# Altium schematic sheet 01_TOP.SchDoc: Diagrama de bloques (hoja TOP)
size 420 x 297 mm; Address1: Hardware en IoT · 2026; SheetNumber: 1; SheetTotal: 6
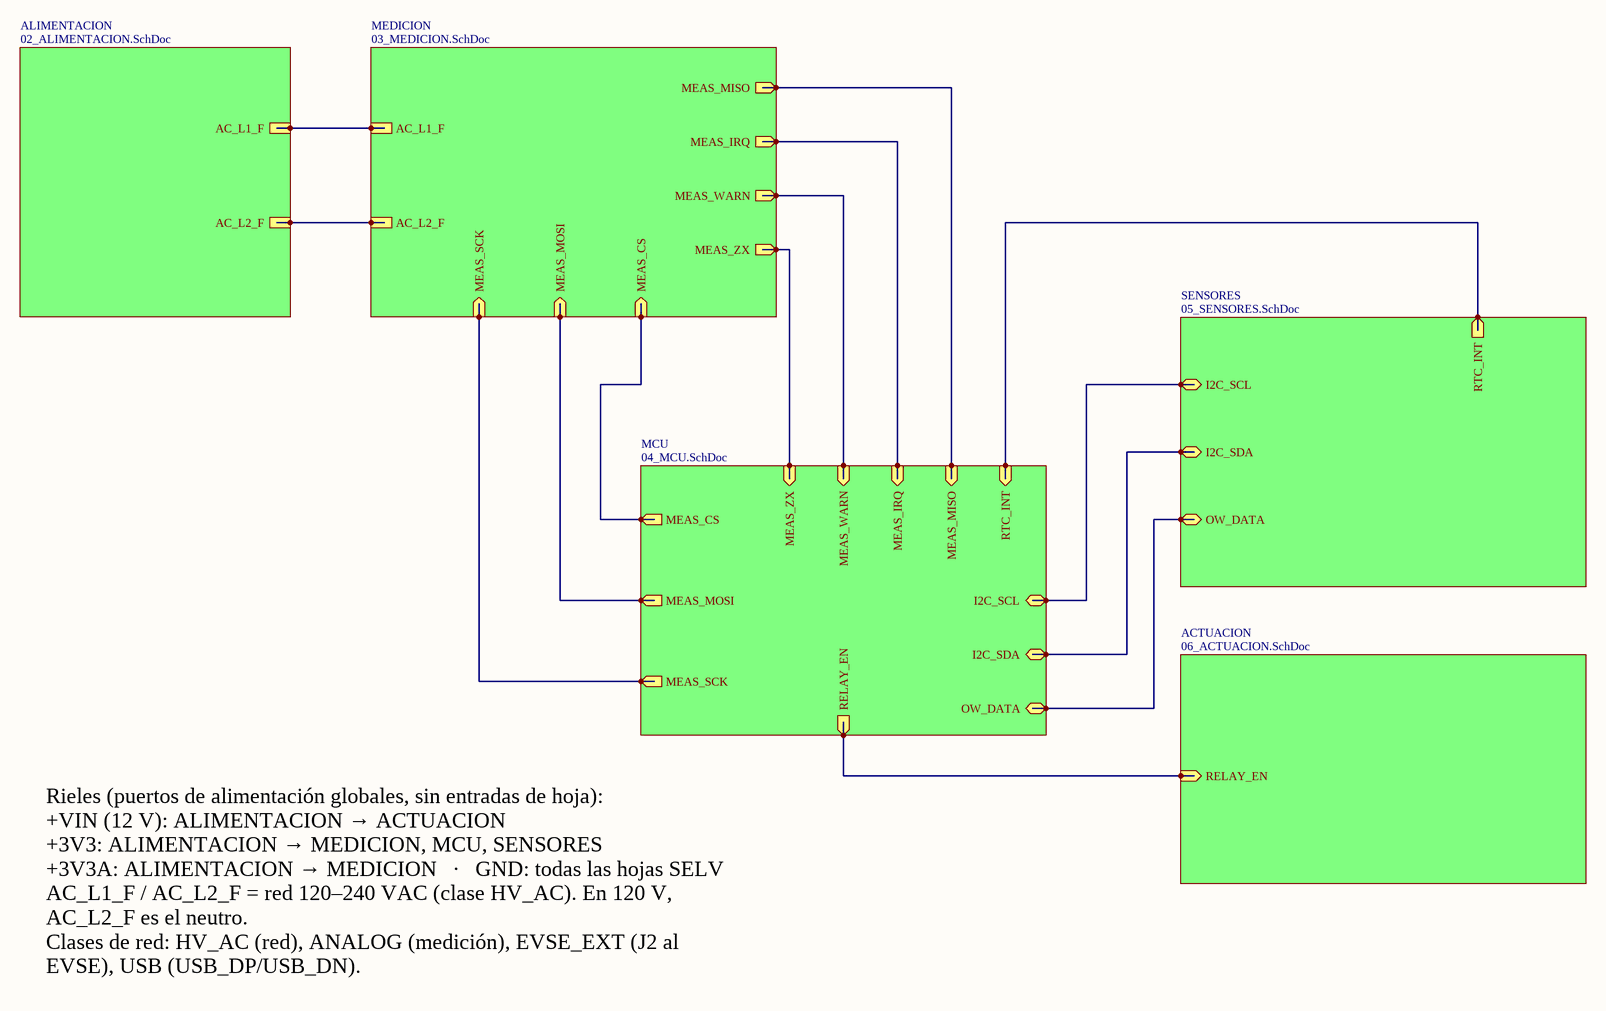
[diagram p0: 01_TOP.SchDoc]

## Sub-sheets
ACTUACION = 06_ACTUACION.SchDoc: RELAY_EN (in)
ALIMENTACION = 02_ALIMENTACION.SchDoc: AC_L1_F, AC_L2_F
MCU = 04_MCU.SchDoc: MEAS_MISO (in), MEAS_IRQ (in), I2C_SDA (bidir), I2C_SCL (bidir), MEAS_SCK (out), MEAS_MOSI (out), MEAS_CS (out), RELAY_EN (out), MEAS_WARN (in), MEAS_ZX (in), RTC_INT (in), OW_DATA (bidir)
MEDICION = 03_MEDICION.SchDoc: AC_L1_F, AC_L2_F, MEAS_IRQ (out), MEAS_WARN (out), MEAS_MISO (out), MEAS_ZX (out), MEAS_SCK (in), MEAS_MOSI (in), MEAS_CS (in)
SENSORES = 05_SENSORES.SchDoc: I2C_SCL (bidir), I2C_SDA (bidir), OW_DATA (bidir), RTC_INT (out)

## Nets
(unnamed): sheet ALIMENTACION/AC_L1_F, sheet MEDICION/AC_L1_F
(unnamed): sheet ALIMENTACION/AC_L2_F, sheet MEDICION/AC_L2_F
(unnamed): sheet MEDICION/MEAS_IRQ, sheet MCU/MEAS_IRQ
(unnamed): sheet MEDICION/MEAS_WARN, sheet MCU/MEAS_WARN
(unnamed): sheet MEDICION/MEAS_MISO, sheet MCU/MEAS_MISO
(unnamed): sheet MEDICION/MEAS_ZX, sheet MCU/MEAS_ZX
(unnamed): sheet MEDICION/MEAS_SCK, sheet MCU/MEAS_SCK
(unnamed): sheet MEDICION/MEAS_MOSI, sheet MCU/MEAS_MOSI
(unnamed): sheet MEDICION/MEAS_CS, sheet MCU/MEAS_CS
(unnamed): sheet MCU/I2C_SDA, sheet SENSORES/I2C_SDA
(unnamed): sheet MCU/I2C_SCL, sheet SENSORES/I2C_SCL
(unnamed): sheet MCU/RELAY_EN, sheet ACTUACION/RELAY_EN
(unnamed): sheet MCU/RTC_INT, sheet SENSORES/RTC_INT
(unnamed): sheet MCU/OW_DATA, sheet SENSORES/OW_DATA

## Notes on the sheet
- Rieles (puertos de alimentación globales, sin entradas de hoja):
  +VIN (12 V): ALIMENTACION → ACTUACION
  +3V3: ALIMENTACION → MEDICION, MCU, SENSORES
  +3V3A: ALIMENTACION → MEDICION   ·   GND: todas las hojas SELV
  AC_L1_F / AC_L2_F = red 120–240 VAC (clase HV_AC). En 120 V, AC_L2_F es el neutro.
  Clases de red: HV_AC (red), ANALOG (medición), EVSE_EXT (J2 al EVSE), USB (USB_DP/USB_DN).
- CONTROL DE CARGA EVSE · HARDWARE EN IOT 2026
- DISEÑO: NICOLÁS GÓMEZ RAMÍREZ
- DWG NO:
- REVISION
- REV:
- DESCRIPTION
- DATE
- APPROVED
- ZONA DE RED 120–240 VAC CON AISLAMIENTO REFORZADO
- USO ACADÉMICO, SIN GARANTÍA.
- ENG:
- APPROVALS
- PROJECT
- DSN:
- CHK:
- REFERENCE DOCUMENTS
- PROJECT REVISION:
- TITLE
- DOCUMENT REVISION:
- DESIGN BY:
- BOM:
- FAB DWG:
- PCB DWG:
- ASSY DWG:
- SCALE:
- A3
- SIZE
- CAGE CODE
- FILE NAME
- DWG NO.
- SHEET
- OF
- REV